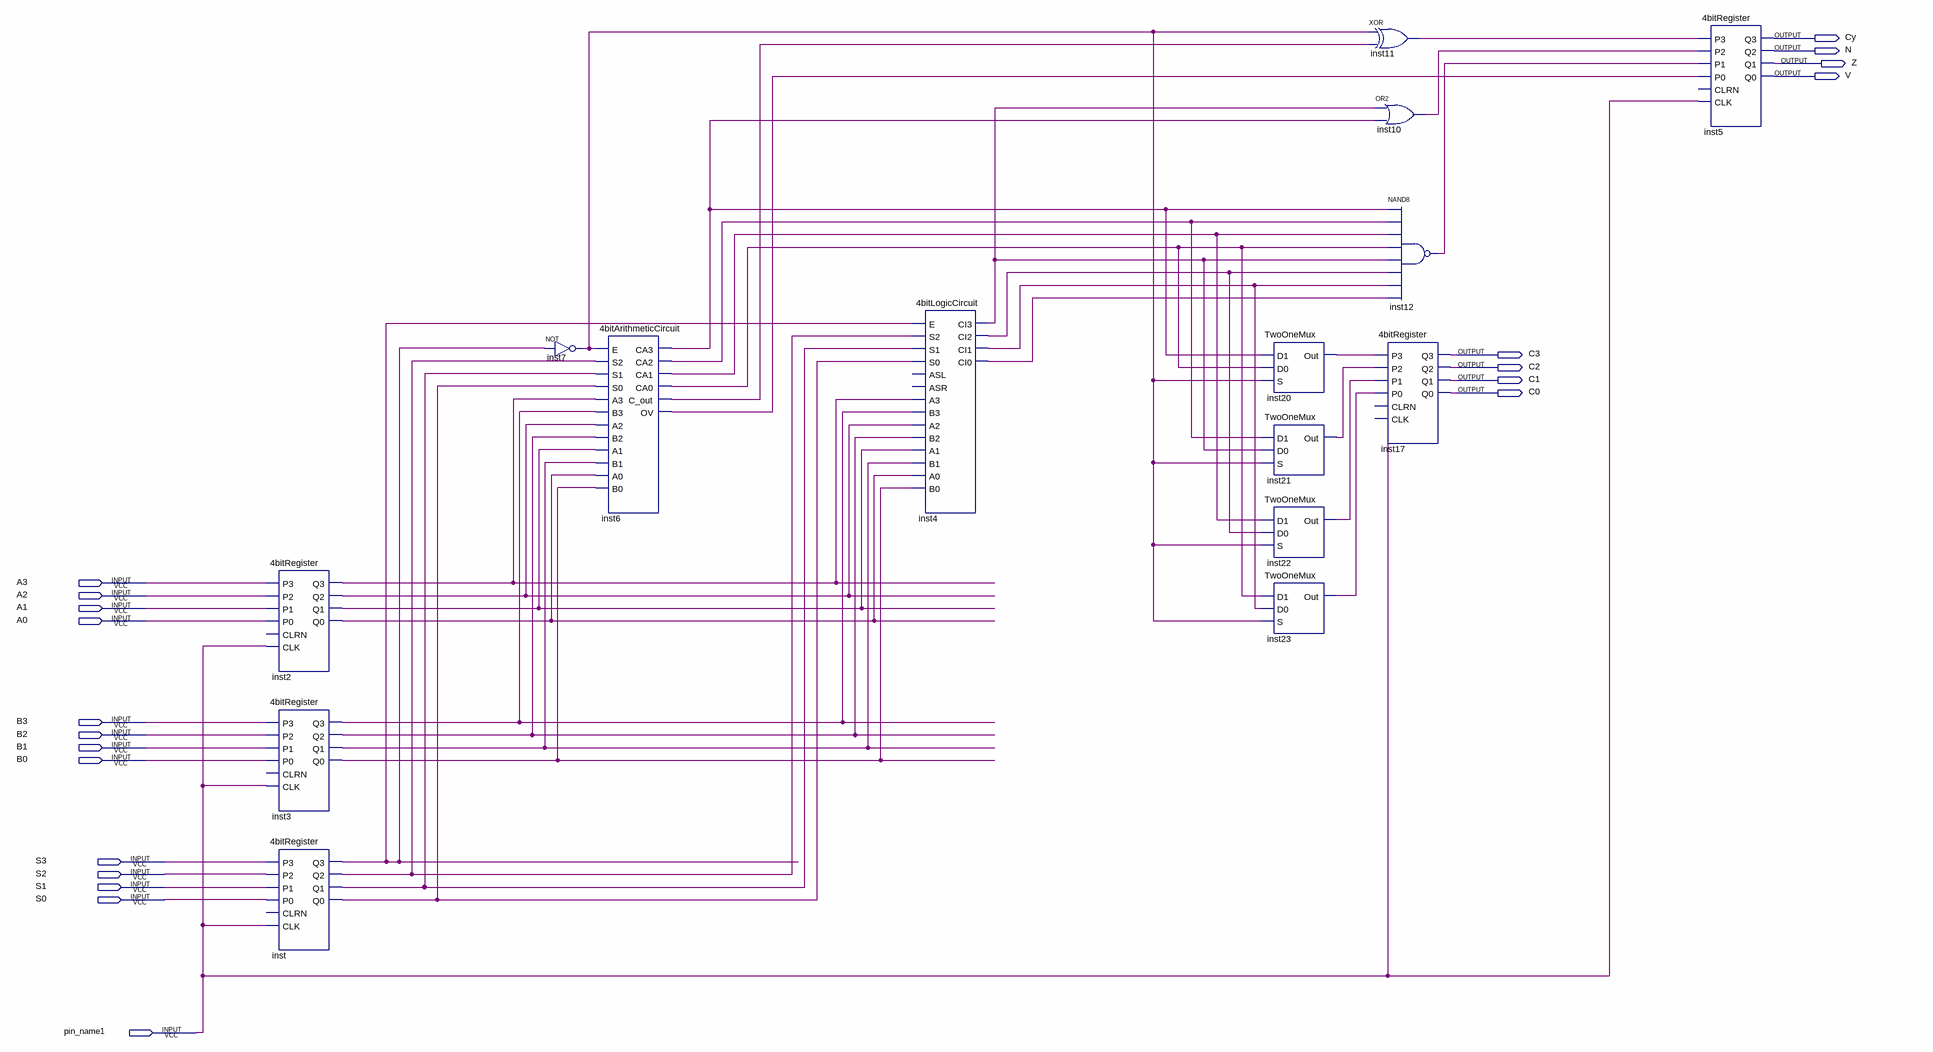
[diagram p0: schematic sheet]
// Quartus schematic Lab3_top.bdf as structural Verilog: 15 symbols, 21 pins
module Lab3_top (
  input  A3,
  input  A2,
  input  A1,
  input  A0,
  input  B3,
  input  B2,
  input  B1,
  input  B0,
  input  S3,
  input  S2,
  input  S1,
  input  S0,
  input  pin_name1,
  output Cy,
  output N,
  output Z,
  output V,
  output C3,
  output C2,
  output C1,
  output C0
);

  wire inst2_q0, inst2_q1, inst2_q2, inst2_q3, inst3_q0, inst3_q1, inst3_q2, inst3_q3, inst4_ci0, inst4_ci1,
       inst4_ci2, inst4_ci3, inst6_c_out, inst6_ca0, inst6_ca1, inst6_ca2, inst6_ca3, inst6_ov, inst7_out,
       inst10_out, inst11_out, inst12_out, inst20_out, inst21_out, inst22_out, inst23_out, inst_q0, inst_q1,
       inst_q2, inst_q3;

  \4bitRegister  inst2 (
    .P3(A3), .P2(A2), .P1(A1), .P0(A0), .CLK(pin_name1), .Q3(inst2_q3), .Q2(inst2_q2), .Q1(inst2_q1),
    .Q0(inst2_q0));  // open: CLRN
  \4bitRegister  inst3 (
    .P3(B3), .P2(B2), .P1(B1), .P0(B0), .CLK(pin_name1), .Q3(inst3_q3), .Q2(inst3_q2), .Q1(inst3_q1),
    .Q0(inst3_q0));  // open: CLRN
  \4bitRegister  inst (
    .P3(S3), .P2(S2), .P1(S1), .P0(S0), .CLK(pin_name1), .Q3(inst_q3), .Q2(inst_q2), .Q1(inst_q1),
    .Q0(inst_q0));  // open: CLRN
  not inst7 (inst7_out, inst_q3);
  \4bitArithmeticCircuit  inst6 (
    .E(inst7_out), .S2(inst_q2), .S1(inst_q1), .S0(inst_q0), .A3(inst2_q3), .B3(inst3_q3), .A2(inst2_q2),
    .B2(inst3_q2), .A1(inst2_q1), .B1(inst3_q1), .A0(inst2_q0), .B0(inst3_q0), .CA3(inst6_ca3),
    .CA2(inst6_ca2), .CA1(inst6_ca1), .CA0(inst6_ca0), .C_out(inst6_c_out), .OV(inst6_ov));
  \4bitLogicCircuit  inst4 (
    .E(inst_q3), .S2(inst_q2), .S1(inst_q1), .S0(inst_q0), .A3(inst2_q3), .B3(inst3_q3), .A2(inst2_q2),
    .B2(inst3_q2), .A1(inst2_q1), .B1(inst3_q1), .A0(inst2_q0), .B0(inst3_q0), .CI3(inst4_ci3),
    .CI2(inst4_ci2), .CI1(inst4_ci1), .CI0(inst4_ci0));  // open: ASL, ASR
  TwoOneMux inst20 (.D1(inst6_ca3), .D0(inst6_ca0), .S(inst7_out), .Out(inst20_out));
  TwoOneMux inst21 (.D1(inst6_ca2), .D0(inst4_ci3), .S(inst7_out), .Out(inst21_out));
  TwoOneMux inst22 (.D1(inst6_ca1), .D0(inst4_ci2), .S(inst7_out), .Out(inst22_out));
  TwoOneMux inst23 (.D1(inst6_ca0), .D0(inst4_ci1), .S(inst7_out), .Out(inst23_out));
  xor inst11 (inst11_out, inst7_out, inst6_c_out);
  or inst10 (inst10_out, inst4_ci3, inst6_ca3);
  nand inst12 (inst12_out, inst6_ca3, inst6_ca2, inst6_ca1, inst6_ca0, inst4_ci3, inst4_ci2, inst4_ci1, inst4_ci0);
  \4bitRegister  inst17 (
    .P3(inst20_out), .P2(inst21_out), .P1(inst22_out), .P0(inst23_out), .CLK(pin_name1), .Q3(C3), .Q2(C2),
    .Q1(C1), .Q0(C0));  // open: CLRN
  \4bitRegister  inst5 (
    .P3(inst11_out), .P2(inst10_out), .P1(inst12_out), .P0(inst6_ov), .CLK(pin_name1), .Q3(Cy), .Q2(N),
    .Q1(Z), .Q0(V));  // open: CLRN
endmodule
